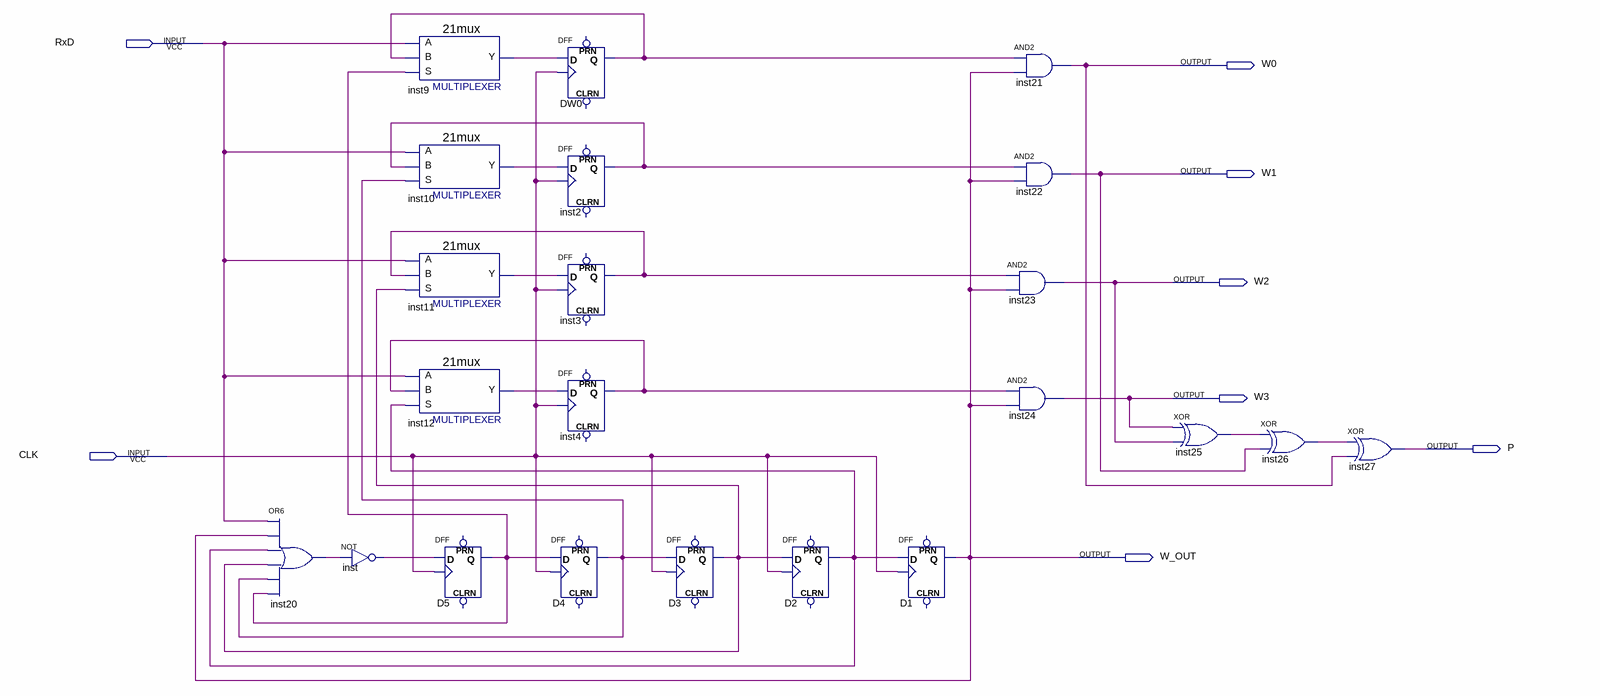
[diagram p0: schematic sheet]
// Quartus schematic CHF_Assign4.bdf as structural Verilog: 22 symbols, 8 pins
module CHF_Assign4 (
  input  RxD,
  input  CLK,
  output W0,
  output W1,
  output W2,
  output W3,
  output P,
  output W_OUT
);

  wire D2_q, D3_q, D4_q, D5_q, DW0_q, inst2_q, inst3_q, inst4_q, inst9_y, inst10_y, inst11_y, inst12_y,
       inst20_out, inst25_out, inst26_out, inst_out;

  or inst20 (inst20_out, RxD, W_OUT, D2_q, D3_q, D4_q, D5_q);
  not inst (inst_out, inst20_out);
  \21mux  inst9 (.S(D5_q), .B(DW0_q), .A(RxD), .Y(inst9_y));
  \21mux  inst10 (.S(D4_q), .B(inst2_q), .A(RxD), .Y(inst10_y));
  \21mux  inst11 (.S(D3_q), .B(inst3_q), .A(RxD), .Y(inst11_y));
  \21mux  inst12 (.S(D2_q), .B(inst4_q), .A(RxD), .Y(inst12_y));
  DFF D5 (.CLK(CLK), .D(inst_out), .Q(D5_q));  // open: CLRN, PRN
  DFF DW0 (.CLK(CLK), .D(inst9_y), .Q(DW0_q));  // open: CLRN, PRN
  DFF inst2 (.CLK(CLK), .D(inst10_y), .Q(inst2_q));  // open: CLRN, PRN
  DFF inst3 (.CLK(CLK), .D(inst11_y), .Q(inst3_q));  // open: CLRN, PRN
  DFF inst4 (.CLK(CLK), .D(inst12_y), .Q(inst4_q));  // open: CLRN, PRN
  DFF D4 (.CLK(CLK), .D(D5_q), .Q(D4_q));  // open: CLRN, PRN
  DFF D3 (.CLK(CLK), .D(D4_q), .Q(D3_q));  // open: CLRN, PRN
  DFF D2 (.CLK(CLK), .D(D3_q), .Q(D2_q));  // open: CLRN, PRN
  DFF D1 (.CLK(CLK), .D(D2_q), .Q(W_OUT));  // open: CLRN, PRN
  and inst23 (W2, inst3_q, W_OUT);
  and inst24 (W3, inst4_q, W_OUT);
  and inst21 (W0, DW0_q, W_OUT);
  and inst22 (W1, inst2_q, W_OUT);
  xor inst25 (inst25_out, W3, W2);
  xor inst26 (inst26_out, inst25_out, W1);
  xor inst27 (P, inst26_out, W0);
endmodule
